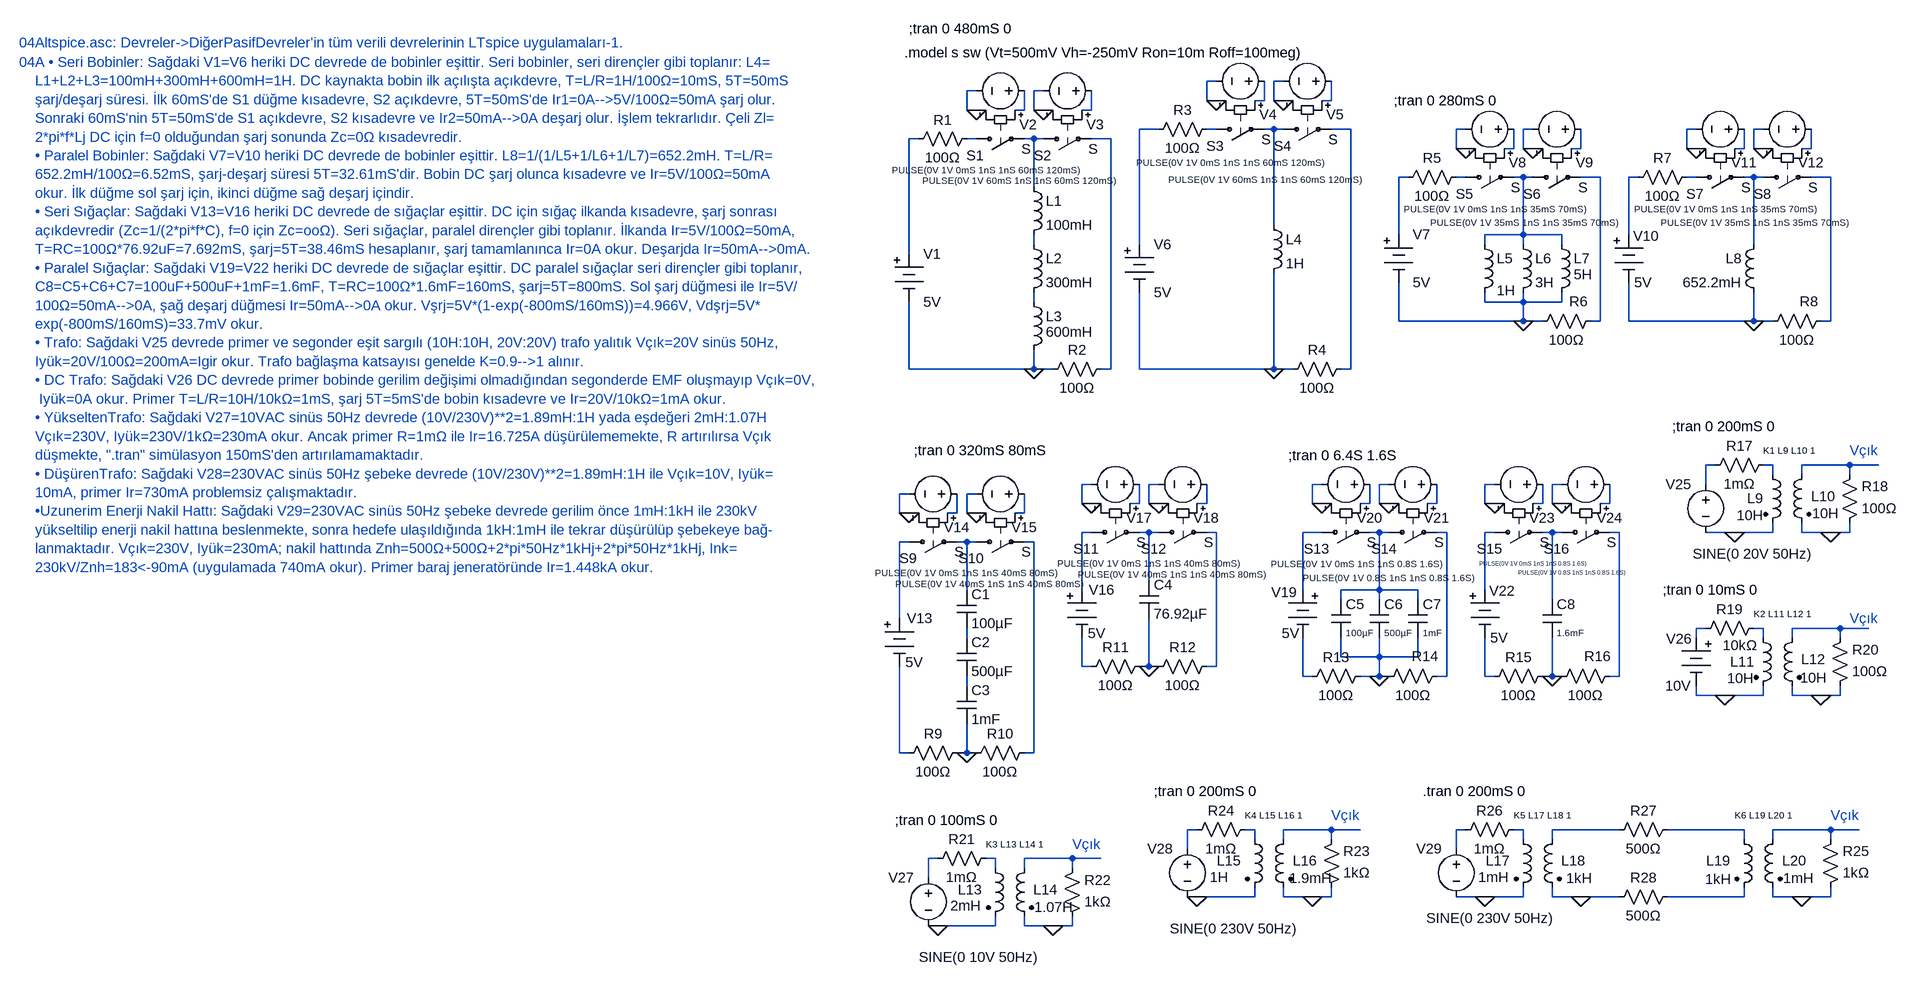
[diagram p0: schematic 04Altspice.asc]
04Altspice.asc, the LTspice schematic file:
Version 4
SHEET 1 3200 2492
WIRE 1360 112 1344 112
WIRE 1472 112 1456 112
WIRE 960 128 944 128
WIRE 1072 128 1056 128
WIRE 1344 144 1344 112
WIRE 1360 144 1344 144
WIRE 1376 144 1360 144
WIRE 1440 144 1440 112
WIRE 1440 144 1424 144
WIRE 1456 144 1456 112
WIRE 1472 144 1456 144
WIRE 1488 144 1472 144
WIRE 1552 144 1552 112
WIRE 1552 144 1536 144
WIRE 944 160 944 128
WIRE 960 160 944 160
WIRE 976 160 960 160
WIRE 1040 160 1040 128
WIRE 1040 160 1024 160
WIRE 1056 160 1056 128
WIRE 1072 160 1056 160
WIRE 1088 160 1072 160
WIRE 1152 160 1152 128
WIRE 1152 160 1136 160
WIRE 1264 192 1232 192
WIRE 1360 192 1344 192
WIRE 1456 192 1440 192
WIRE 1472 192 1456 192
WIRE 1584 192 1552 192
WIRE 1776 192 1760 192
WIRE 1888 192 1872 192
WIRE 2160 192 2144 192
WIRE 2272 192 2256 192
WIRE 864 208 848 208
WIRE 960 208 944 208
WIRE 1056 208 1040 208
WIRE 1072 208 1056 208
WIRE 1184 208 1152 208
WIRE 1760 224 1760 192
WIRE 1776 224 1760 224
WIRE 1792 224 1776 224
WIRE 1856 224 1856 192
WIRE 1856 224 1840 224
WIRE 1872 224 1872 192
WIRE 1888 224 1872 224
WIRE 1904 224 1888 224
WIRE 1968 224 1968 192
WIRE 1968 224 1952 224
WIRE 2144 224 2144 192
WIRE 2160 224 2144 224
WIRE 2176 224 2160 224
WIRE 2240 224 2240 192
WIRE 2240 224 2224 224
WIRE 2256 224 2256 192
WIRE 2272 224 2256 224
WIRE 2288 224 2272 224
WIRE 2352 224 2352 192
WIRE 2352 224 2336 224
WIRE 1680 272 1664 272
WIRE 1776 272 1760 272
WIRE 1872 272 1856 272
WIRE 1888 272 1872 272
WIRE 2000 272 1968 272
WIRE 2064 272 2048 272
WIRE 2160 272 2144 272
WIRE 2256 272 2240 272
WIRE 2272 272 2256 272
WIRE 2384 272 2352 272
WIRE 1056 288 1056 208
WIRE 1456 352 1456 192
WIRE 1664 368 1664 272
WIRE 1872 368 1872 272
WIRE 1872 368 1808 368
WIRE 1936 368 1872 368
WIRE 2048 368 2048 272
WIRE 1056 384 1056 368
WIRE 1232 384 1232 192
WIRE 1808 384 1808 368
WIRE 1872 384 1872 368
WIRE 1936 384 1936 368
WIRE 2256 384 2256 272
WIRE 848 400 848 208
WIRE 1056 480 1056 464
WIRE 1808 480 1808 464
WIRE 1872 480 1872 464
WIRE 1872 480 1808 480
WIRE 1936 480 1936 464
WIRE 1936 480 1872 480
WIRE 1664 512 1664 448
WIRE 1872 512 1872 480
WIRE 1872 512 1664 512
WIRE 1904 512 1872 512
WIRE 2000 512 2000 272
WIRE 2000 512 1984 512
WIRE 2048 512 2048 448
WIRE 2256 512 2256 464
WIRE 2256 512 2048 512
WIRE 2288 512 2256 512
WIRE 2384 512 2384 272
WIRE 2384 512 2368 512
WIRE 848 592 848 480
WIRE 1056 592 1056 560
WIRE 1056 592 848 592
WIRE 1088 592 1056 592
WIRE 1184 592 1184 208
WIRE 1184 592 1168 592
WIRE 1232 592 1232 464
WIRE 1456 592 1456 432
WIRE 1456 592 1232 592
WIRE 1488 592 1456 592
WIRE 1584 592 1584 192
WIRE 1584 592 1568 592
WIRE 2192 752 2176 752
WIRE 2288 752 2272 752
WIRE 2416 752 2336 752
WIRE 2464 752 2416 752
WIRE 2288 768 2288 752
WIRE 2336 768 2336 752
WIRE 2416 768 2416 752
WIRE 1152 784 1136 784
WIRE 1264 784 1248 784
WIRE 1536 784 1520 784
WIRE 1648 784 1632 784
WIRE 1824 784 1808 784
WIRE 1936 784 1920 784
WIRE 2176 784 2176 752
WIRE 848 800 832 800
WIRE 960 800 944 800
WIRE 1136 816 1136 784
WIRE 1152 816 1136 816
WIRE 1168 816 1152 816
WIRE 1232 816 1232 784
WIRE 1232 816 1216 816
WIRE 1248 816 1248 784
WIRE 1264 816 1248 816
WIRE 1280 816 1264 816
WIRE 1344 816 1344 784
WIRE 1344 816 1328 816
WIRE 1520 816 1520 784
WIRE 1536 816 1520 816
WIRE 1552 816 1536 816
WIRE 1616 816 1616 784
WIRE 1616 816 1600 816
WIRE 1632 816 1632 784
WIRE 1648 816 1632 816
WIRE 1664 816 1648 816
WIRE 1728 816 1728 784
WIRE 1728 816 1712 816
WIRE 1808 816 1808 784
WIRE 1824 816 1808 816
WIRE 1840 816 1824 816
WIRE 1904 816 1904 784
WIRE 1904 816 1888 816
WIRE 1920 816 1920 784
WIRE 1936 816 1920 816
WIRE 1952 816 1936 816
WIRE 2016 816 2016 784
WIRE 2016 816 2000 816
WIRE 832 832 832 800
WIRE 848 832 832 832
WIRE 864 832 848 832
WIRE 928 832 928 800
WIRE 928 832 912 832
WIRE 944 832 944 800
WIRE 960 832 944 832
WIRE 976 832 960 832
WIRE 1040 832 1040 800
WIRE 1040 832 1024 832
WIRE 1152 864 1136 864
WIRE 1248 864 1232 864
WIRE 1264 864 1248 864
WIRE 1360 864 1344 864
WIRE 1536 864 1504 864
WIRE 1632 864 1616 864
WIRE 1648 864 1632 864
WIRE 1744 864 1728 864
WIRE 1824 864 1808 864
WIRE 1920 864 1904 864
WIRE 1936 864 1920 864
WIRE 2032 864 2016 864
WIRE 2224 864 2176 864
WIRE 2288 864 2288 848
WIRE 2288 864 2224 864
WIRE 2336 864 2336 848
WIRE 2384 864 2336 864
WIRE 2416 864 2416 848
WIRE 2416 864 2384 864
WIRE 848 880 832 880
WIRE 944 880 928 880
WIRE 960 880 944 880
WIRE 1056 880 1040 880
WIRE 1248 944 1248 864
WIRE 944 960 944 880
WIRE 1136 960 1136 864
WIRE 1504 960 1504 864
WIRE 1632 960 1632 864
WIRE 1632 960 1568 960
WIRE 1696 960 1632 960
WIRE 1808 960 1808 864
WIRE 1568 976 1568 960
WIRE 1632 976 1632 960
WIRE 1696 976 1696 960
WIRE 1920 976 1920 864
WIRE 832 1008 832 880
WIRE 2176 1024 2160 1024
WIRE 2272 1024 2256 1024
WIRE 2400 1024 2320 1024
WIRE 2448 1024 2400 1024
WIRE 944 1040 944 1024
WIRE 2160 1040 2160 1024
WIRE 2272 1040 2272 1024
WIRE 2320 1040 2320 1024
WIRE 2400 1040 2400 1024
WIRE 1568 1072 1568 1040
WIRE 1632 1072 1632 1040
WIRE 1632 1072 1568 1072
WIRE 1696 1072 1696 1040
WIRE 1696 1072 1632 1072
WIRE 1136 1088 1136 1040
WIRE 1152 1088 1136 1088
WIRE 1248 1088 1248 1008
WIRE 1248 1088 1232 1088
WIRE 1264 1088 1248 1088
WIRE 1360 1088 1360 864
WIRE 1360 1088 1344 1088
WIRE 1504 1104 1504 1040
WIRE 1520 1104 1504 1104
WIRE 1632 1104 1632 1072
WIRE 1632 1104 1600 1104
WIRE 1648 1104 1632 1104
WIRE 1744 1104 1744 864
WIRE 1744 1104 1728 1104
WIRE 1808 1104 1808 1040
WIRE 1824 1104 1808 1104
WIRE 1920 1104 1920 1040
WIRE 1920 1104 1904 1104
WIRE 1936 1104 1920 1104
WIRE 2032 1104 2032 864
WIRE 2032 1104 2016 1104
WIRE 944 1120 944 1104
WIRE 2160 1136 2160 1120
WIRE 2208 1136 2160 1136
WIRE 2272 1136 2272 1120
WIRE 2272 1136 2208 1136
WIRE 2320 1136 2320 1120
WIRE 2368 1136 2320 1136
WIRE 2400 1136 2400 1120
WIRE 2400 1136 2368 1136
WIRE 832 1232 832 1088
WIRE 848 1232 832 1232
WIRE 944 1232 944 1184
WIRE 944 1232 928 1232
WIRE 960 1232 944 1232
WIRE 1056 1232 1056 880
WIRE 1056 1232 1040 1232
WIRE 1328 1360 1312 1360
WIRE 1424 1360 1408 1360
WIRE 1552 1360 1472 1360
WIRE 1600 1360 1552 1360
WIRE 1776 1360 1760 1360
WIRE 1872 1360 1856 1360
WIRE 2032 1360 1920 1360
WIRE 2240 1360 2112 1360
WIRE 2384 1360 2288 1360
WIRE 2432 1360 2384 1360
WIRE 1424 1376 1424 1360
WIRE 1472 1376 1472 1360
WIRE 1552 1376 1552 1360
WIRE 1872 1376 1872 1360
WIRE 1920 1376 1920 1360
WIRE 2240 1376 2240 1360
WIRE 2288 1376 2288 1360
WIRE 2384 1376 2384 1360
WIRE 1312 1392 1312 1360
WIRE 1760 1392 1760 1360
WIRE 896 1408 880 1408
WIRE 992 1408 976 1408
WIRE 1120 1408 1040 1408
WIRE 1168 1408 1120 1408
WIRE 992 1424 992 1408
WIRE 1040 1424 1040 1408
WIRE 1120 1424 1120 1408
WIRE 880 1440 880 1408
WIRE 1328 1472 1312 1472
WIRE 1424 1472 1424 1456
WIRE 1424 1472 1328 1472
WIRE 1472 1472 1472 1456
WIRE 1520 1472 1472 1472
WIRE 1552 1472 1552 1456
WIRE 1552 1472 1520 1472
WIRE 1808 1472 1760 1472
WIRE 1872 1472 1872 1456
WIRE 1872 1472 1808 1472
WIRE 1920 1472 1920 1456
WIRE 1968 1472 1920 1472
WIRE 2032 1472 1968 1472
WIRE 2240 1472 2240 1456
WIRE 2240 1472 2112 1472
WIRE 2288 1472 2288 1456
WIRE 2336 1472 2288 1472
WIRE 2384 1472 2384 1456
WIRE 2384 1472 2336 1472
WIRE 896 1520 880 1520
WIRE 992 1520 992 1504
WIRE 992 1520 896 1520
WIRE 1040 1520 1040 1504
WIRE 1088 1520 1040 1520
WIRE 1120 1520 1120 1504
WIRE 1120 1520 1088 1520
FLAG 960 160 0
FLAG 1072 160 0
FLAG 1056 592 0
FLAG 1360 144 0
FLAG 1472 144 0
FLAG 1456 592 0
FLAG 1776 224 0
FLAG 1888 224 0
FLAG 1872 512 0
FLAG 2160 224 0
FLAG 2272 224 0
FLAG 2256 512 0
FLAG 848 832 0
FLAG 960 832 0
FLAG 944 1232 0
FLAG 1152 816 0
FLAG 1264 816 0
FLAG 1248 1088 0
FLAG 1536 816 0
FLAG 1648 816 0
FLAG 1632 1104 0
FLAG 1824 816 0
FLAG 1936 816 0
FLAG 1920 1104 0
FLAG 2384 864 0
FLAG 2224 864 0
FLAG 2368 1136 0
FLAG 2208 1136 0
FLAG 1088 1520 0
FLAG 896 1520 0
FLAG 1520 1472 0
FLAG 1328 1472 0
FLAG 1968 1472 0
FLAG 1808 1472 0
FLAG 2336 1472 0
SYMBOL Misc\\battery 848 384 R0
SYMATTR InstName V1
SYMATTR Value 5V
SYMBOL ind 1040 272 R0
SYMATTR InstName L1
SYMATTR Value 100mH
SYMBOL ind 1040 464 R0
WINDOW 3 36 66 Left 2
SYMATTR Value 600mH
SYMATTR InstName L3
SYMBOL res 960 192 R90
WINDOW 0 0 56 VBottom 2
WINDOW 3 32 56 VTop 2
SYMATTR InstName R1
SYMATTR Value 100Ω
SYMBOL res 1184 576 R90
WINDOW 0 0 56 VBottom 2
WINDOW 3 32 56 VTop 2
SYMATTR InstName R2
SYMATTR Value 100Ω
SYMBOL sw 944 208 M90
WINDOW 0 28 29 VLeft 2
WINDOW 3 17 107 VLeft 2
SYMATTR InstName S1
SYMATTR Value S
SYMBOL voltage 1056 128 M270
WINDOW 0 -56 -5 VRight 2
WINDOW 3 -132 -75 VRight 1
WINDOW 123 0 0 Left 0
WINDOW 39 0 0 Left 0
SYMATTR InstName V2
SYMATTR Value PULSE(0V 1V 0mS 1nS 1nS 60mS 120mS)
SYMBOL ind 1040 368 R0
SYMATTR InstName L2
SYMATTR Value 300mH
SYMBOL sw 1056 208 M90
WINDOW 0 28 29 VLeft 2
WINDOW 3 17 107 VLeft 2
SYMATTR InstName S2
SYMATTR Value S
SYMBOL voltage 1168 128 M270
WINDOW 0 -56 -5 VRight 2
WINDOW 3 -150 -23 VRight 1
WINDOW 123 0 0 Left 0
WINDOW 39 0 0 Left 0
SYMATTR InstName V3
SYMATTR Value PULSE(0V 1V 60mS 1nS 1nS 60mS 120mS)
SYMBOL ind 1440 336 R0
SYMATTR InstName L4
SYMATTR Value 1H
SYMBOL res 1360 176 R90
WINDOW 0 0 56 VBottom 2
WINDOW 3 32 56 VTop 2
SYMATTR InstName R3
SYMATTR Value 100Ω
SYMBOL sw 1344 192 M90
WINDOW 0 28 29 VLeft 2
WINDOW 3 17 107 VLeft 2
SYMATTR InstName S3
SYMATTR Value S
SYMBOL voltage 1456 112 M270
WINDOW 0 -56 -5 VRight 2
WINDOW 3 -136 -83 VRight 1
WINDOW 123 0 0 Left 0
WINDOW 39 0 0 Left 0
SYMATTR InstName V4
SYMATTR Value PULSE(0V 1V 0mS 1nS 1nS 60mS 120mS)
SYMBOL sw 1456 192 M90
WINDOW 0 28 29 VLeft 2
WINDOW 3 17 107 VLeft 2
SYMATTR InstName S4
SYMATTR Value S
SYMBOL voltage 1568 112 M270
WINDOW 0 -56 -5 VRight 2
WINDOW 3 -164 -33 VRight 1
WINDOW 123 0 0 Left 0
WINDOW 39 0 0 Left 0
SYMATTR InstName V5
SYMATTR Value PULSE(0V 1V 60mS 1nS 1nS 60mS 120mS)
SYMBOL Misc\\battery 1232 368 R0
SYMATTR InstName V6
SYMATTR Value 5V
SYMBOL res 1584 576 R90
WINDOW 0 0 56 VBottom 2
WINDOW 3 32 56 VTop 2
SYMATTR InstName R4
SYMATTR Value 100Ω
SYMBOL Misc\\battery 1664 352 R0
SYMATTR InstName V7
SYMATTR Value 5V
SYMBOL ind 1856 368 R0
SYMATTR InstName L6
SYMATTR Value 3H
SYMBOL ind 1920 368 R0
WINDOW 3 36 66 Left 2
SYMATTR Value 5H
SYMATTR InstName L7
SYMBOL res 1776 256 R90
WINDOW 0 0 56 VBottom 2
WINDOW 3 32 56 VTop 2
SYMATTR InstName R5
SYMATTR Value 100Ω
SYMBOL res 2000 496 R90
WINDOW 0 -1 36 VBottom 2
WINDOW 3 32 56 VTop 2
SYMATTR InstName R6
SYMATTR Value 100Ω
SYMBOL sw 1760 272 M90
WINDOW 0 28 29 VLeft 2
WINDOW 3 17 107 VLeft 2
SYMATTR InstName S5
SYMATTR Value S
SYMBOL voltage 1872 192 M270
WINDOW 0 -56 -5 VRight 2
WINDOW 3 -133 -104 VRight 1
WINDOW 123 0 0 Left 0
WINDOW 39 0 0 Left 0
SYMATTR InstName V8
SYMATTR Value PULSE(0V 1V 0mS 1nS 1nS 35mS 70mS)
SYMBOL ind 1792 368 R0
WINDOW 3 36 93 Left 2
SYMATTR Value 1H
SYMATTR InstName L5
SYMBOL sw 1872 272 M90
WINDOW 0 28 29 VLeft 2
WINDOW 3 17 107 VLeft 2
SYMATTR InstName S6
SYMATTR Value S
SYMBOL voltage 1984 192 M270
WINDOW 0 -56 -5 VRight 2
WINDOW 3 -156 -45 VRight 1
WINDOW 123 0 0 Left 0
WINDOW 39 0 0 Left 0
SYMATTR InstName V9
SYMATTR Value PULSE(0V 1V 35mS 1nS 1nS 35mS 70mS)
SYMBOL Misc\\battery 2048 352 R0
WINDOW 0 7 18 Left 2
WINDOW 3 9 96 Left 2
SYMATTR InstName V10
SYMATTR Value 5V
SYMBOL ind 2272 368 M0
SYMATTR InstName L8
SYMATTR Value 652.2mH
SYMBOL res 2160 256 R90
WINDOW 0 0 56 VBottom 2
WINDOW 3 32 56 VTop 2
SYMATTR InstName R7
SYMATTR Value 100Ω
SYMBOL res 2384 496 R90
WINDOW 0 -1 36 VBottom 2
WINDOW 3 32 56 VTop 2
SYMATTR InstName R8
SYMATTR Value 100Ω
SYMBOL sw 2144 272 M90
WINDOW 0 28 29 VLeft 2
WINDOW 3 17 107 VLeft 2
SYMATTR InstName S7
SYMATTR Value S
SYMBOL voltage 2256 192 M270
WINDOW 0 -56 -5 VRight 2
WINDOW 3 -133 -104 VRight 1
WINDOW 123 0 0 Left 0
WINDOW 39 0 0 Left 0
SYMATTR InstName V11
SYMATTR Value PULSE(0V 1V 0mS 1nS 1nS 35mS 70mS)
SYMBOL sw 2256 272 M90
WINDOW 0 28 29 VLeft 2
WINDOW 3 17 107 VLeft 2
SYMATTR InstName S8
SYMATTR Value S
SYMBOL voltage 2368 192 M270
WINDOW 0 -56 -5 VRight 2
WINDOW 3 -156 -45 VRight 1
WINDOW 123 0 0 Left 0
WINDOW 39 0 0 Left 0
SYMATTR InstName V12
SYMATTR Value PULSE(0V 1V 35mS 1nS 1nS 35mS 70mS)
SYMBOL Misc\\battery 832 992 R0
WINDOW 0 12 16 Left 2
WINDOW 3 10 89 Left 2
SYMATTR InstName V13
SYMATTR Value 5V
SYMBOL res 944 1216 R90
WINDOW 0 0 56 VBottom 2
WINDOW 3 32 56 VTop 2
SYMATTR InstName R9
SYMATTR Value 100Ω
SYMBOL res 1056 1216 R90
WINDOW 0 0 56 VBottom 2
WINDOW 3 32 56 VTop 2
SYMATTR InstName R10
SYMATTR Value 100Ω
SYMBOL sw 832 880 M90
WINDOW 0 28 29 VLeft 2
WINDOW 3 17 107 VLeft 2
SYMATTR InstName S9
SYMATTR Value S
SYMBOL voltage 944 800 M270
WINDOW 0 -56 -5 VRight 2
WINDOW 3 -132 -150 VRight 1
WINDOW 123 0 0 Left 0
WINDOW 39 0 0 Left 0
SYMATTR InstName V14
SYMATTR Value PULSE(0V 1V 0mS 1nS 1nS 40mS 80mS)
SYMBOL sw 944 880 M90
WINDOW 0 28 29 VLeft 2
WINDOW 3 17 107 VLeft 2
SYMATTR InstName S10
SYMATTR Value S
SYMBOL voltage 1056 800 M270
WINDOW 0 -56 -5 VRight 2
WINDOW 3 -150 -81 VRight 1
WINDOW 123 0 0 Left 0
WINDOW 39 0 0 Left 0
SYMATTR InstName V15
SYMATTR Value PULSE(0V 1V 40mS 1nS 1nS 40mS 80mS)
SYMBOL cap 928 960 R0
SYMATTR InstName C1
SYMATTR Value 100µF
SYMBOL cap 928 1040 R0
SYMATTR InstName C2
SYMATTR Value 500µF
SYMBOL cap 928 1120 R0
SYMATTR InstName C3
SYMATTR Value 1mF
SYMBOL Misc\\battery 1136 944 R0
WINDOW 0 12 16 Left 2
WINDOW 3 10 89 Left 2
SYMATTR InstName V16
SYMATTR Value 5V
SYMBOL res 1248 1072 R90
WINDOW 0 0 56 VBottom 2
WINDOW 3 32 56 VTop 2
SYMATTR InstName R11
SYMATTR Value 100Ω
SYMBOL res 1360 1072 R90
WINDOW 0 0 56 VBottom 2
WINDOW 3 32 56 VTop 2
SYMATTR InstName R12
SYMATTR Value 100Ω
SYMBOL sw 1136 864 M90
WINDOW 0 28 29 VLeft 2
WINDOW 3 17 107 VLeft 2
SYMATTR InstName S11
SYMATTR Value S
SYMBOL voltage 1248 784 M270
WINDOW 0 -56 -5 VRight 2
WINDOW 3 -132 -150 VRight 1
WINDOW 123 0 0 Left 0
WINDOW 39 0 0 Left 0
SYMATTR InstName V17
SYMATTR Value PULSE(0V 1V 0mS 1nS 1nS 40mS 80mS)
SYMBOL sw 1248 864 M90
WINDOW 0 28 29 VLeft 2
WINDOW 3 17 107 VLeft 2
SYMATTR InstName S12
SYMATTR Value S
SYMBOL voltage 1360 784 M270
WINDOW 0 -56 -5 VRight 2
WINDOW 3 -150 -81 VRight 1
WINDOW 123 0 0 Left 0
WINDOW 39 0 0 Left 0
SYMATTR InstName V18
SYMATTR Value PULSE(0V 1V 40mS 1nS 1nS 40mS 80mS)
SYMBOL cap 1232 944 R0
SYMATTR InstName C4
SYMATTR Value 76.92µF
SYMBOL Misc\\battery 1504 944 M0
WINDOW 0 9 20 Left 2
WINDOW 3 5 89 Left 2
SYMATTR InstName V19
SYMATTR Value 5V
SYMBOL res 1616 1088 R90
WINDOW 0 0 56 VBottom 2
WINDOW 3 32 56 VTop 2
SYMATTR InstName R13
SYMATTR Value 100Ω
SYMBOL res 1744 1088 R90
WINDOW 0 -1 36 VBottom 2
WINDOW 3 32 56 VTop 2
SYMATTR InstName R14
SYMATTR Value 100Ω
SYMBOL sw 1520 864 M90
WINDOW 0 28 29 VLeft 2
WINDOW 3 17 107 VLeft 2
SYMATTR InstName S13
SYMATTR Value S
SYMBOL voltage 1632 784 M270
WINDOW 0 -56 -5 VRight 2
WINDOW 3 -133 -104 VRight 1
WINDOW 123 0 0 Left 0
WINDOW 39 0 0 Left 0
SYMATTR InstName V20
SYMATTR Value PULSE(0V 1V 0mS 1nS 1nS 0.8S 1.6S)
SYMBOL sw 1632 864 M90
WINDOW 0 28 29 VLeft 2
WINDOW 3 17 107 VLeft 2
SYMATTR InstName S14
SYMATTR Value S
SYMBOL voltage 1744 784 M270
WINDOW 0 -56 -5 VRight 2
WINDOW 3 -156 -45 VRight 1
WINDOW 123 0 0 Left 0
WINDOW 39 0 0 Left 0
SYMATTR InstName V21
SYMATTR Value PULSE(0V 1V 0.8S 1nS 1nS 0.8S 1.6S)
SYMBOL Misc\\battery 1808 944 R0
WINDOW 0 7 18 Left 2
WINDOW 3 9 96 Left 2
SYMATTR InstName V22
SYMATTR Value 5V
SYMBOL res 1920 1088 R90
WINDOW 0 0 56 VBottom 2
WINDOW 3 32 56 VTop 2
SYMATTR InstName R15
SYMATTR Value 100Ω
SYMBOL res 2032 1088 R90
WINDOW 0 -1 36 VBottom 2
WINDOW 3 32 56 VTop 2
SYMATTR InstName R16
SYMATTR Value 100Ω
SYMBOL sw 1808 864 M90
WINDOW 0 28 29 VLeft 2
WINDOW 3 17 107 VLeft 2
SYMATTR InstName S15
SYMATTR Value S
SYMBOL voltage 1920 784 M270
WINDOW 0 -56 -5 VRight 2
WINDOW 3 -133 -57 VRight 0
WINDOW 123 0 0 Left 0
WINDOW 39 0 0 Left 0
SYMATTR InstName V23
SYMATTR Value PULSE(0V 1V 0mS 1nS 1nS 0.8S 1.6S)
SYMBOL sw 1920 864 M90
WINDOW 0 28 29 VLeft 2
WINDOW 3 17 107 VLeft 2
SYMATTR InstName S16
SYMATTR Value S
SYMBOL voltage 2032 784 M270
WINDOW 0 -56 -5 VRight 2
WINDOW 3 -148 -10 VRight 0
WINDOW 123 0 0 Left 0
WINDOW 39 0 0 Left 0
SYMATTR InstName V24
SYMATTR Value PULSE(0V 1V 0.8S 1nS 1nS 0.8S 1.6S)
SYMBOL cap 1552 976 R0
WINDOW 3 24 56 Left 1
SYMATTR Value 100µF
SYMATTR InstName C5
SYMBOL cap 1616 976 R0
WINDOW 3 24 56 Left 1
SYMATTR Value 500µF
SYMATTR InstName C6
SYMBOL cap 1680 976 R0
WINDOW 3 24 56 Left 1
SYMATTR Value 1mF
SYMATTR InstName C7
SYMBOL cap 1904 976 R0
WINDOW 3 24 56 Left 1
SYMATTR Value 1.6mF
SYMATTR InstName C8
SYMBOL voltage 2176 768 M0
WINDOW 3 -176 132 Left 2
WINDOW 123 0 0 Left 0
WINDOW 39 0 0 Left 0
SYMATTR Value SINE(0 20V 50Hz)
SYMATTR InstName V25
SYMBOL res 2288 736 R90
WINDOW 0 0 56 VBottom 2
WINDOW 3 32 56 VTop 2
SYMATTR InstName R17
SYMATTR Value 1mΩ
SYMBOL ind2 2272 752 R0
WINDOW 0 -27 56 Left 2
WINDOW 3 -44 84 Left 2
SYMATTR InstName L9
SYMATTR Value 10H
SYMATTR Type ind
SYMBOL ind2 2352 752 M0
WINDOW 0 -40 52 Left 2
WINDOW 3 -46 81 Left 2
SYMATTR InstName L10
SYMATTR Value 10H
SYMATTR Type ind
SYMBOL res 2400 864 M180
WINDOW 0 36 76 Left 2
WINDOW 3 36 40 Left 2
SYMATTR InstName R18
SYMATTR Value 100Ω
SYMBOL res 2272 1008 R90
WINDOW 0 0 56 VBottom 2
WINDOW 3 29 39 VTop 2
SYMATTR InstName R19
SYMATTR Value 10kΩ
SYMBOL ind2 2256 1024 R0
WINDOW 0 -39 56 Left 2
WINDOW 3 -44 84 Left 2
SYMATTR InstName L11
SYMATTR Value 10H
SYMATTR Type ind
SYMBOL ind2 2336 1024 M0
WINDOW 0 -40 52 Left 2
WINDOW 3 -42 83 Left 2
SYMATTR InstName L12
SYMATTR Value 10H
SYMATTR Type ind
SYMBOL res 2384 1136 M180
WINDOW 0 36 76 Left 2
WINDOW 3 36 40 Left 2
SYMATTR InstName R20
SYMATTR Value 100Ω
SYMBOL Misc\\battery 2160 1024 M0
WINDOW 0 7 18 Left 2
WINDOW 3 9 96 Left 2
SYMATTR InstName V26
SYMATTR Value 10V
SYMBOL voltage 880 1424 M0
WINDOW 3 -182 149 Left 2
WINDOW 123 0 0 Left 0
WINDOW 39 0 0 Left 0
SYMATTR Value SINE(0 10V 50Hz)
SYMATTR InstName V27
SYMBOL ind2 976 1408 R0
WINDOW 0 -47 52 Left 2
WINDOW 3 -59 79 Left 2
SYMATTR InstName L13
SYMATTR Value 2mH
SYMATTR Type ind
SYMBOL ind2 1056 1408 M0
WINDOW 0 -40 52 Left 2
WINDOW 3 -65 81 Left 2
SYMATTR InstName L14
SYMATTR Value 1.07H
SYMATTR Type ind
SYMBOL res 1104 1520 M180
WINDOW 0 36 76 Left 2
WINDOW 3 36 40 Left 2
SYMATTR InstName R22
SYMATTR Value 1kΩ
SYMBOL res 992 1392 R90
WINDOW 0 0 56 VBottom 2
WINDOW 3 32 56 VTop 2
SYMATTR InstName R21
SYMATTR Value 1mΩ
SYMBOL voltage 1312 1376 M0
WINDOW 3 -182 149 Left 2
WINDOW 123 0 0 Left 0
WINDOW 39 0 0 Left 0
SYMATTR Value SINE(0 230V 50Hz)
SYMATTR InstName V28
SYMBOL ind2 1408 1360 R0
WINDOW 0 -47 52 Left 2
WINDOW 3 -59 79 Left 2
SYMATTR InstName L15
SYMATTR Value 1H
SYMATTR Type ind
SYMBOL ind2 1488 1360 M0
WINDOW 0 -40 52 Left 2
WINDOW 3 -65 81 Left 2
SYMATTR InstName L16
SYMATTR Value 1.9mH
SYMATTR Type ind
SYMBOL res 1536 1472 M180
WINDOW 0 36 76 Left 2
WINDOW 3 36 40 Left 2
SYMATTR InstName R23
SYMATTR Value 1kΩ
SYMBOL res 1424 1344 R90
WINDOW 0 0 56 VBottom 2
WINDOW 3 32 56 VTop 2
SYMATTR InstName R24
SYMATTR Value 1mΩ
SYMBOL voltage 1760 1376 M0
WINDOW 3 -162 132 Left 2
WINDOW 123 0 0 Left 0
WINDOW 39 0 0 Left 0
SYMATTR Value SINE(0 230V 50Hz)
SYMATTR InstName V29
SYMBOL ind2 1856 1360 R0
WINDOW 0 -47 52 Left 2
WINDOW 3 -59 79 Left 2
SYMATTR InstName L17
SYMATTR Value 1mH
SYMATTR Type ind
SYMBOL ind2 1936 1360 M0
WINDOW 0 -40 52 Left 2
WINDOW 3 -50 81 Left 2
SYMATTR InstName L18
SYMATTR Value 1kH
SYMATTR Type ind
SYMBOL res 2368 1472 M180
WINDOW 0 36 76 Left 2
WINDOW 3 36 40 Left 2
SYMATTR InstName R25
SYMATTR Value 1kΩ
SYMBOL res 1872 1344 R90
WINDOW 0 0 56 VBottom 2
WINDOW 3 32 56 VTop 2
SYMATTR InstName R26
SYMATTR Value 1mΩ
SYMBOL res 2128 1344 R90
WINDOW 0 0 56 VBottom 2
WINDOW 3 32 56 VTop 2
SYMATTR InstName R27
SYMATTR Value 500Ω
SYMBOL res 2128 1456 R90
WINDOW 0 0 56 VBottom 2
WINDOW 3 32 56 VTop 2
SYMATTR InstName R28
SYMATTR Value 500Ω
SYMBOL ind2 2224 1360 R0
WINDOW 0 -47 52 Left 2
WINDOW 3 -49 83 Left 2
SYMATTR InstName L19
SYMATTR Value 1kH
SYMATTR Type ind
SYMBOL ind2 2304 1360 M0
WINDOW 0 -40 52 Left 2
WINDOW 3 -52 81 Left 2
SYMATTR InstName L20
SYMATTR Value 1mH
SYMATTR Type ind
TEXT -784 48 Left 2 ;04Altspice.asc: Devreler->DiğerPasifDevreler'in tüm verili devrelerinin LTspice uygulamaları-1.
TEXT -784 80 Left 2 ;04A • Seri Bobinler: Sağdaki V1=V6 heriki DC devrede de bobinler eşittir. Seri bobinler, seri dirençler gibi toplanır: L4=\n    L1+L2+L3=100mH+300mH+600mH=1H. DC kaynakta bobin ilk açılışta açıkdevre, T=L/R=1H/100Ω=10mS, 5T=50mS \n    şarj/deşarj süresi. İlk 60mS'de S1 düğme kısadevre, S2 açıkdevre, 5T=50mS'de Ir1=0A-->5V/100Ω=50mA şarj olur. \n    Sonraki 60mS'nin 5T=50mS'de S1 açıkdevre, S2 kısadevre ve Ir2=50mA-->0A deşarj olur. İşlem tekrarlıdır. Çeli Zl=\n    2*pi*f*Lj DC için f=0 olduğundan şarj sonunda Zc=0Ω kısadevredir.\n    • Paralel Bobinler: Sağdaki V7=V10 heriki DC devrede de bobinler eşittir. L8=1/(1/L5+1/L6+1/L7)=652.2mH. T=L/R=\n    652.2mH/100Ω=6.52mS, şarj-deşarj süresi 5T=32.61mS'dir. Bobin DC şarj olunca kısadevre ve Ir=5V/100Ω=50mA \n    okur. İlk düğme sol şarj için, ikinci düğme sağ deşarj içindir.\n    • Seri Sığaçlar: Sağdaki V13=V16 heriki DC devrede de sığaçlar eşittir. DC için sığaç ilkanda kısadevre, şarj sonrası \n    açıkdevredir (Zc=1/(2*pi*f*C), f=0 için Zc=ooΩ). Seri sığaçlar, paralel dirençler gibi toplanır. İlkanda Ir=5V/100Ω=50mA,\n    T=RC=100Ω*76.92uF=7.692mS, şarj=5T=38.46mS hesaplanır, şarj tamamlanınca Ir=0A okur. Deşarjda Ir=50mA-->0mA.\n    • Paralel Sığaçlar: Sağdaki V19=V22 heriki DC devrede de sığaçlar eşittir. DC paralel sığaçlar seri dirençler gibi toplanır,\n    C8=C5+C6+C7=100uF+500uF+1mF=1.6mF, T=RC=100Ω*1.6mF=160mS, şarj=5T=800mS. Sol şarj düğmesi ile Ir=5V/\n    100Ω=50mA-->0A, şağ deşarj düğmesi Ir=50mA-->0A okur. Vşrj=5V*(1-exp(-800mS/160mS))=4.966V, Vdşrj=5V*\n    exp(-800mS/160mS)=33.7mV okur.\n    • Trafo: Sağdaki V25 devrede primer ve segonder eşit sargılı (10H:10H, 20V:20V) trafo yalıtık Vçık=20V sinüs 50Hz, \n    Iyük=20V/100Ω=200mA=Igir okur. Trafo bağlaşma katsayısı genelde K=0.9-->1 alınır.\n    • DC Trafo: Sağdaki V26 DC devrede primer bobinde gerilim değişimi olmadığından segonderde EMF oluşmayıp Vçık=0V,\n     Iyük=0A okur. Primer T=L/R=10H/10kΩ=1mS, şarj 5T=5mS'de bobin kısadevre ve Ir=20V/10kΩ=1mA okur.\n    • YükseltenTrafo: Sağdaki V27=10VAC sinüs 50Hz devrede (10V/230V)**2=1.89mH:1H yada eşdeğeri 2mH:1.07H\n    Vçık=230V, Iyük=230V/1kΩ=230mA okur. Ancak primer R=1mΩ ile Ir=16.725A düşürülememekte, R artırılırsa Vçık \n    düşmekte, ".tran" simülasyon 150mS'den artırılamamaktadır.\n    • DüşürenTrafo: Sağdaki V28=230VAC sinüs 50Hz şebeke devrede (10V/230V)**2=1.89mH:1H ile Vçık=10V, Iyük=\n    10mA, primer Ir=730mA problemsiz çalışmaktadır.\n    •Uzunerim Enerji Nakil Hattı: Sağdaki V29=230VAC sinüs 50Hz şebeke devrede gerilim önce 1mH:1kH ile 230kV\n    yükseltilip enerji nakil hattına beslenmekte, sonra hedefe ulaşıldığında 1kH:1mH ile tekrar düşürülüp şebekeye bağ-\n    lanmaktadır. Vçık=230V, Iyük=230mA; nakil hattında Znh=500Ω+500Ω+2*pi*50Hz*1kHj+2*pi*50Hz*1kHj, Ink=\n    230kV/Znh=183<-90mA (uygulamada 740mA okur). Primer baraj jeneratöründe Ir=1.448kA okur.
TEXT 840 64 Left 2 !.model s sw (Vt=500mV Vh=-250mV Ron=10m Roff=100meg)
TEXT 848 24 Left 2 !;tran 0 480mS 0
TEXT 1656 144 Left 2 !;tran 0 280mS 0
TEXT 856 728 Left 2 !;tran 0 320mS 80mS
TEXT 1480 736 Left 2 !;tran 0 6.4S 1.6S
TEXT 2416 728 Left 2 ;Vçık
TEXT 2120 688 Left 2 !;tran 0 200mS 0
TEXT 2272 728 Left 1 !K1 L9 L10 1
TEXT 2416 1008 Left 2 ;Vçık
TEXT 2104 960 Left 2 !;tran 0 10mS 0
TEXT 2256 1000 Left 1 !K2 L11 L12 1
TEXT 1120 1384 Left 2 ;Vçık
TEXT 824 1344 Left 2 !;tran 0 100mS 0
TEXT 976 1384 Left 1 !K3 L13 L14 1
TEXT 1552 1336 Left 2 ;Vçık
TEXT 1256 1296 Left 2 !;tran 0 200mS 0
TEXT 1408 1336 Left 1 !K4 L15 L16 1
TEXT 2384 1336 Left 2 ;Vçık
TEXT 1704 1296 Left 2 !.tran 0 200mS 0
TEXT 1856 1336 Left 1 !K5 L17 L18 1
TEXT 2224 1336 Left 1 !K6 L19 L20 1

The netlist it stands for:
* 04Altspice.asc
V1 N009 0 5V
L1 N011 N025 100mH
L3 N026 0 600mH
R1 N010 N009 100Ω
R2 N012 0 100Ω
S1 N010 N011 N003 0 S
V2 N003 0 PULSE(0V 1V 0mS 1nS 1nS 60mS 120mS)
L2 N025 N026 300mH
S2 N011 N012 N004 0 S
V3 N004 0 PULSE(0V 1V 60mS 1nS 1nS 60mS 120mS)
L4 N007 0 1H
R3 N006 N005 100Ω
S3 N006 N007 N001 0 S
V4 N001 0 PULSE(0V 1V 0mS 1nS 1nS 60mS 120mS)
S4 N007 N008 N002 0 S
V5 N002 0 PULSE(0V 1V 60mS 1nS 1nS 60mS 120mS)
V6 N005 0 5V
R4 N008 0 100Ω
V7 N017 0 5V
L6 N019 0 3H
L7 N019 0 5H
R5 N018 N017 100Ω
R6 N020 0 100Ω
S5 N018 N019 N013 0 S
V8 N013 0 PULSE(0V 1V 0mS 1nS 1nS 35mS 70mS)
L5 N019 0 1H
S6 N019 N020 N014 0 S
V9 N014 0 PULSE(0V 1V 35mS 1nS 1nS 35mS 70mS)
V10 N021 0 5V
L8 N023 0 652.2mH
R7 N022 N021 100Ω
R8 N024 0 100Ω
S7 N022 N023 N015 0 S
V11 N015 0 PULSE(0V 1V 0mS 1nS 1nS 35mS 70mS)
S8 N023 N024 N016 0 S
V12 N016 0 PULSE(0V 1V 35mS 1nS 1nS 35mS 70mS)
V13 N047 N058 5V
R9 0 N058 100Ω
R10 N049 0 100Ω
S9 N047 N048 N036 0 S
V14 N036 0 PULSE(0V 1V 0mS 1nS 1nS 40mS 80mS)
S10 N048 N049 N037 0 S
V15 N037 0 PULSE(0V 1V 40mS 1nS 1nS 40mS 80mS)
C1 N048 N053 100µF
C2 N053 N057 500µF
C3 N057 0 1mF
V16 N038 N054 5V
R11 0 N054 100Ω
R12 N040 0 100Ω
S11 N038 N039 N030 0 S
V17 N030 0 PULSE(0V 1V 0mS 1nS 1nS 40mS 80mS)
S12 N039 N040 N031 0 S
V18 N031 0 PULSE(0V 1V 40mS 1nS 1nS 40mS 80mS)
C4 N039 0 76.92µF
V19 N041 N055 5V
R13 0 N055 100Ω
R14 N043 0 100Ω
S13 N041 N042 N032 0 S
V20 N032 0 PULSE(0V 1V 0mS 1nS 1nS 0.8S 1.6S)
S14 N042 N043 N033 0 S
V21 N033 0 PULSE(0V 1V 0.8S 1nS 1nS 0.8S 1.6S)
V22 N044 N056 5V
R15 0 N056 100Ω
R16 N046 0 100Ω
S15 N044 N045 N034 0 S
V23 N034 0 PULSE(0V 1V 0mS 1nS 1nS 0.8S 1.6S)
S16 N045 N046 N035 0 S
V24 N035 0 PULSE(0V 1V 0.8S 1nS 1nS 0.8S 1.6S)
C5 N042 0 100µF
C6 N042 0 500µF
C7 N042 0 1mF
C8 N045 0 1.6mF
V25 N027 0 SINE(0 20V 50Hz)
R17 N028 N027 1mΩ
L9 N028 0 10H
L10 N029 0 10H
R18 0 N029 100Ω
R19 N051 N050 10kΩ
L11 N051 0 10H
L12 N052 0 10H
R20 0 N052 100Ω
V26 N050 0 10V
V27 N067 0 SINE(0 10V 50Hz)
L13 N068 0 2mH
L14 N069 0 1.07H
R22 0 N069 1kΩ
R21 N068 N067 1mΩ
V28 N059 0 SINE(0 230V 50Hz)
L15 N060 0 1H
L16 N061 0 1.9mH
R23 0 N061 1kΩ
R24 N060 N059 1mΩ
V29 N062 0 SINE(0 230V 50Hz)
L17 N063 0 1mH
L18 N064 0 1kH
R25 0 N066 1kΩ
R26 N063 N062 1mΩ
R27 N065 N064 500Ω
R28 N070 0 500Ω
L19 N065 N070 1kH
L20 N066 0 1mH
* 04Altspice.asc: Devreler->DiğerPasifDevreler'in tüm verili devrelerinin LTspice uygulamaları-1.
* 04A • Seri Bobinler: Sağdaki V1=V6 heriki DC devrede de bobinler eşittir. Seri bobinler, seri dirençler gibi toplanır: L4=
*     L1+L2+L3=100mH+300mH+600mH=1H. DC kaynakta bobin ilk açılışta açıkdevre, T=L/R=1H/100Ω=10mS, 5T=50mS
*     şarj/deşarj süresi. İlk 60mS'de S1 düğme kısadevre, S2 açıkdevre, 5T=50mS'de Ir1=0A-->5V/100Ω=50mA şarj olur.
*     Sonraki 60mS'nin 5T=50mS'de S1 açıkdevre, S2 kısadevre ve Ir2=50mA-->0A deşarj olur. İşlem tekrarlıdır. Çeli Zl=
*     2*pi*f*Lj DC için f=0 olduğundan şarj sonunda Zc=0Ω kısadevredir.
*     • Paralel Bobinler: Sağdaki V7=V10 heriki DC devrede de bobinler eşittir. L8=1/(1/L5+1/L6+1/L7)=652.2mH. T=L/R=
*     652.2mH/100Ω=6.52mS, şarj-deşarj süresi 5T=32.61mS'dir. Bobin DC şarj olunca kısadevre ve Ir=5V/100Ω=50mA
*     okur. İlk düğme sol şarj için, ikinci düğme sağ deşarj içindir.
*     • Seri Sığaçlar: Sağdaki V13=V16 heriki DC devrede de sığaçlar eşittir. DC için sığaç ilkanda kısadevre, şarj sonrası
*     açıkdevredir (Zc=1/(2*pi*f*C), f=0 için Zc=ooΩ). Seri sığaçlar, paralel dirençler gibi toplanır. İlkanda Ir=5V/100Ω=50mA,
*     T=RC=100Ω*76.92uF=7.692mS, şarj=5T=38.46mS hesaplanır, şarj tamamlanınca Ir=0A okur. Deşarjda Ir=50mA-->0mA.
*     • Paralel Sığaçlar: Sağdaki V19=V22 heriki DC devrede de sığaçlar eşittir. DC paralel sığaçlar seri dirençler gibi toplanır,
*     C8=C5+C6+C7=100uF+500uF+1mF=1.6mF, T=RC=100Ω*1.6mF=160mS, şarj=5T=800mS. Sol şarj düğmesi ile Ir=5V/
*     100Ω=50mA-->0A, şağ deşarj düğmesi Ir=50mA-->0A okur. Vşrj=5V*(1-exp(-800mS/160mS))=4.966V, Vdşrj=5V*
*     exp(-800mS/160mS)=33.7mV okur.
*     • Trafo: Sağdaki V25 devrede primer ve segonder eşit sargılı (10H:10H, 20V:20V) trafo yalıtık Vçık=20V sinüs 50Hz,
*     Iyük=20V/100Ω=200mA=Igir okur. Trafo bağlaşma katsayısı genelde K=0.9-->1 alınır.
*     • DC Trafo: Sağdaki V26 DC devrede primer bobinde gerilim değişimi olmadığından segonderde EMF oluşmayıp Vçık=0V,
*      Iyük=0A okur. Primer T=L/R=10H/10kΩ=1mS, şarj 5T=5mS'de bobin kısadevre ve Ir=20V/10kΩ=1mA okur.
*     • YükseltenTrafo: Sağdaki V27=10VAC sinüs 50Hz devrede (10V/230V)**2=1.89mH:1H yada eşdeğeri 2mH:1.07H
*     Vçık=230V, Iyük=230V/1kΩ=230mA okur. Ancak primer R=1mΩ ile Ir=16.725A düşürülememekte, R artırılırsa Vçık
*     düşmekte, ".tran" simülasyon 150mS'den artırılamamaktadır.
*     • DüşürenTrafo: Sağdaki V28=230VAC sinüs 50Hz şebeke devrede (10V/230V)**2=1.89mH:1H ile Vçık=10V, Iyük=
*     10mA, primer Ir=730mA problemsiz çalışmaktadır.
*     •Uzunerim Enerji Nakil Hattı: Sağdaki V29=230VAC sinüs 50Hz şebeke devrede gerilim önce 1mH:1kH ile 230kV
*     yükseltilip enerji nakil hattına beslenmekte, sonra hedefe ulaşıldığında 1kH:1mH ile tekrar düşürülüp şebekeye bağ-
*     lanmaktadır. Vçık=230V, Iyük=230mA; nakil hattında Znh=500Ω+500Ω+2*pi*50Hz*1kHj+2*pi*50Hz*1kHj, Ink=
*     230kV/Znh=183<-90mA (uygulamada 740mA okur). Primer baraj jeneratöründe Ir=1.448kA okur.
.model s sw (Vt=500mV Vh=-250mV Ron=10m Roff=100meg)
;tran 0 480mS 0
;tran 0 280mS 0
;tran 0 320mS 80mS
;tran 0 6.4S 1.6S
* Vçık
;tran 0 200mS 0
K1 L9 L10 1
* Vçık
;tran 0 10mS 0
K2 L11 L12 1
* Vçık
;tran 0 100mS 0
K3 L13 L14 1
* Vçık
;tran 0 200mS 0
K4 L15 L16 1
* Vçık
.tran 0 200mS 0
K5 L17 L18 1
K6 L19 L20 1
.backanno
.end